# Altium schematic sheet signal_processing_assembly.SchDoc: Main Analog signal processing assembly
size A4; DocumentNumber: ADC-SCH-05; SheetNumber: 5; SheetTotal: 20
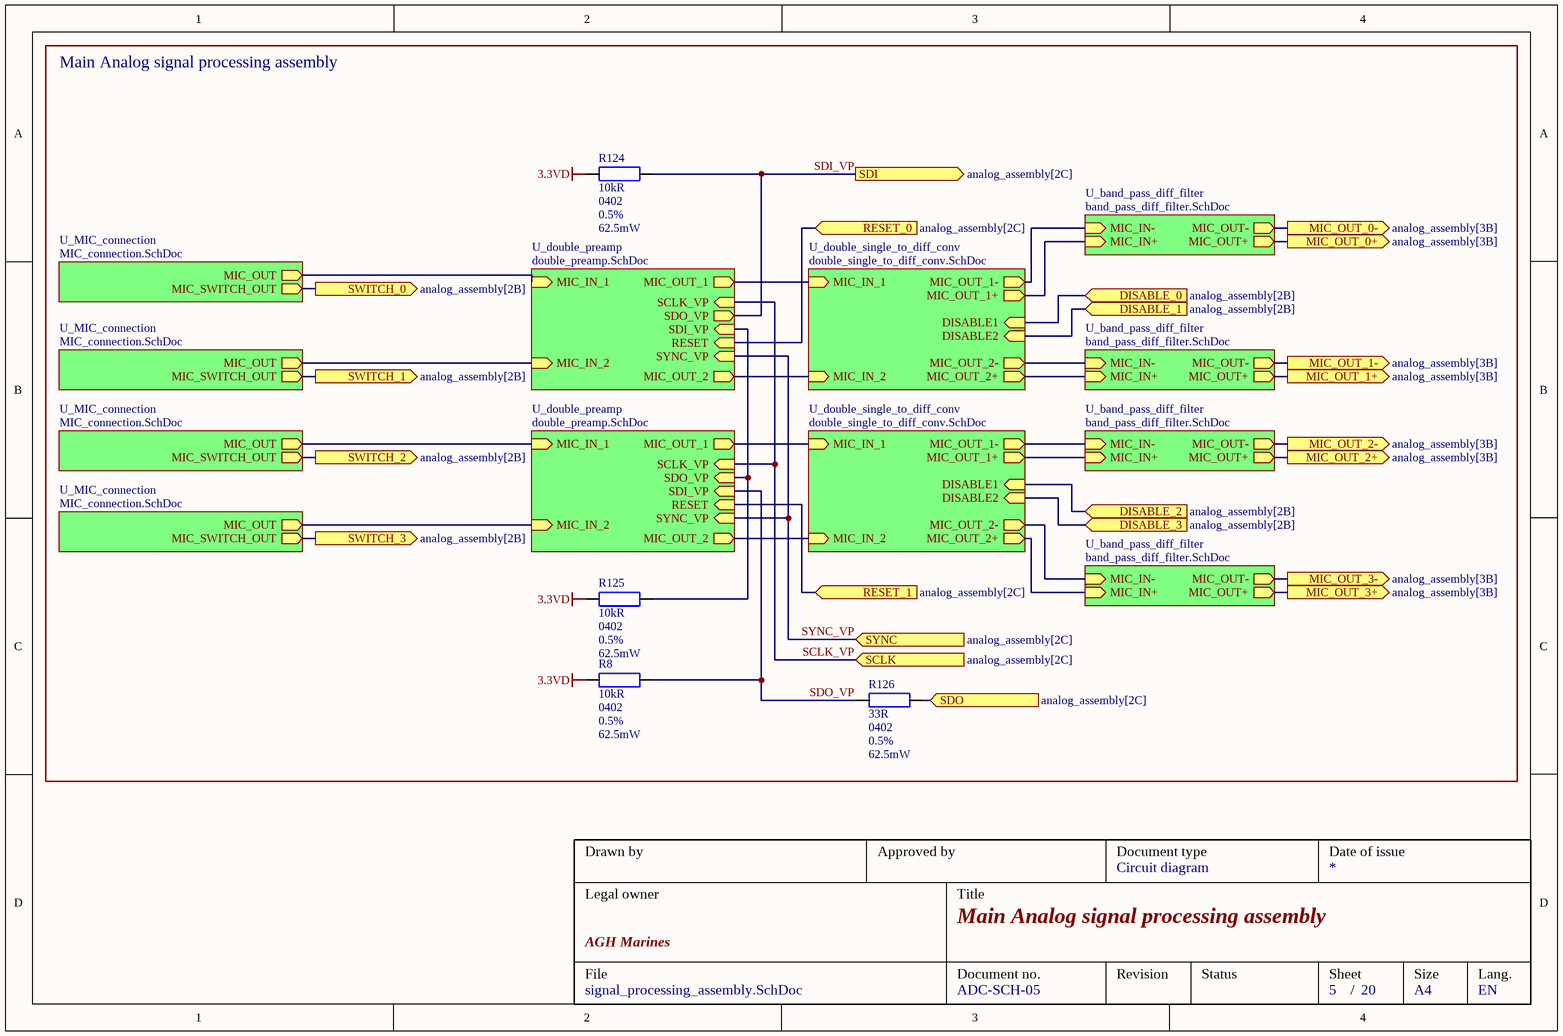
[diagram p0: signal_processing_assembly.SchDoc]

## Parts
R8  value 10kR  Package: 0402  Tolerance: 0.5%  Power: 62.5mW  [RESC_0402]  (hidden comment: AC0402DR-0710KL)
R124  value 10kR  Package: 0402  Tolerance: 0.5%  Power: 62.5mW  [RESC_0402]  (hidden comment: AC0402DR-0710KL)
R125  value 10kR  Package: 0402  Tolerance: 0.5%  Power: 62.5mW  [RESC_0402]  (hidden comment: AC0402DR-0710KL)
R126  value 33R  Package: 0402  Tolerance: 0.5%  Power: 62.5mW  [RESC_0402]  (hidden comment: RG1005R-330-D-T10)

## Blocks framed on the sheet
Main Analog signal processing assembly: R8 R124-R126

## Sub-sheets
U_band_pass_diff_filter = band_pass_diff_filter.SchDoc: MIC_IN+ (in), MIC_IN- (in), MIC_OUT+ (out), MIC_OUT- (out)
U_band_pass_diff_filter = band_pass_diff_filter.SchDoc: MIC_IN+ (in), MIC_IN- (in), MIC_OUT+ (out), MIC_OUT- (out)
U_band_pass_diff_filter = band_pass_diff_filter.SchDoc: MIC_IN+ (in), MIC_IN- (in), MIC_OUT+ (out), MIC_OUT- (out)
U_band_pass_diff_filter = band_pass_diff_filter.SchDoc: MIC_IN+ (in), MIC_IN- (in), MIC_OUT+ (out), MIC_OUT- (out)
U_double_preamp = double_preamp.SchDoc: MIC_IN_1 (in), MIC_OUT_1 (out), SDO_VP (out), SDI_VP (in), SYNC_VP (in), SCLK_VP (in), RESET (in), MIC_OUT_2 (out), MIC_IN_2 (in)
U_double_preamp = double_preamp.SchDoc: MIC_IN_1 (in), MIC_OUT_1 (out), SDO_VP (in), SDI_VP (in), SYNC_VP (in), SCLK_VP (in), RESET (in), MIC_OUT_2 (out), MIC_IN_2 (in)
U_double_single_to_diff_conv = double_single_to_diff_conv.SchDoc: DISABLE1 (in), DISABLE2 (in), MIC_OUT_1- (out), MIC_OUT_1+ (out), MIC_OUT_2- (out), MIC_OUT_2+ (out), MIC_IN_1 (in), MIC_IN_2 (in)
U_double_single_to_diff_conv = double_single_to_diff_conv.SchDoc: DISABLE1 (in), DISABLE2 (in), MIC_OUT_1- (out), MIC_OUT_1+ (out), MIC_OUT_2- (out), MIC_OUT_2+ (out), MIC_IN_1 (in), MIC_IN_2 (in)
U_MIC_connection = MIC_connection.SchDoc: MIC_OUT (out), MIC_SWITCH_OUT (out)
U_MIC_connection = MIC_connection.SchDoc: MIC_OUT (out), MIC_SWITCH_OUT (out)
U_MIC_connection = MIC_connection.SchDoc: MIC_OUT (out), MIC_SWITCH_OUT (out)
U_MIC_connection = MIC_connection.SchDoc: MIC_OUT (out), MIC_SWITCH_OUT (out)

## Ports
DISABLE_0 (in, see analog_assembly[2B]), DISABLE_1 (in, see analog_assembly[2B]), DISABLE_2 (in, see analog_assembly[2B]), DISABLE_3 (in, see analog_assembly[2B]), MIC_OUT_0+ (out, see analog_assembly[3B]), MIC_OUT_0- (out, see analog_assembly[3B]), MIC_OUT_1+ (out, see analog_assembly[3B]), MIC_OUT_1- (out, see analog_assembly[3B]), MIC_OUT_2+ (out, see analog_assembly[3B]), MIC_OUT_2- (out, see analog_assembly[3B]), MIC_OUT_3+ (out, see analog_assembly[3B]), MIC_OUT_3- (out, see analog_assembly[3B]), RESET_0 (in, see analog_assembly[2C]), RESET_1 (in, see analog_assembly[2C]), SCLK (in, see analog_assembly[2C]), SDI (out, see analog_assembly[2C]), SDO (in, see analog_assembly[2C]), SWITCH_0 (out, see analog_assembly[2B]), SWITCH_1 (out, see analog_assembly[2B]), SWITCH_2 (out, see analog_assembly[2B]), SWITCH_3 (out, see analog_assembly[2B]), SYNC (in, see analog_assembly[2C])

## Nets
3.3VD: R8.2 R124.2 R125.2
DISABLE_0: port DISABLE_0, sheet U_double_single_to_diff_conv/DISABLE1
DISABLE_1: port DISABLE_1, sheet U_double_single_to_diff_conv/DISABLE2
DISABLE_2: port DISABLE_2, sheet U_double_single_to_diff_conv/DISABLE1
DISABLE_3: port DISABLE_3, sheet U_double_single_to_diff_conv/DISABLE2
MIC_OUT_0+: port MIC_OUT_0+, sheet U_band_pass_diff_filter/MIC_OUT+
MIC_OUT_0-: port MIC_OUT_0-, sheet U_band_pass_diff_filter/MIC_OUT-
MIC_OUT_1+: port MIC_OUT_1+, sheet U_band_pass_diff_filter/MIC_OUT+
MIC_OUT_1-: port MIC_OUT_1-, sheet U_band_pass_diff_filter/MIC_OUT-
MIC_OUT_2+: port MIC_OUT_2+, sheet U_band_pass_diff_filter/MIC_OUT+
MIC_OUT_2-: port MIC_OUT_2-, sheet U_band_pass_diff_filter/MIC_OUT-
MIC_OUT_3+: port MIC_OUT_3+, sheet U_band_pass_diff_filter/MIC_OUT+
MIC_OUT_3-: port MIC_OUT_3-, sheet U_band_pass_diff_filter/MIC_OUT-
RESET_0: port RESET_0, sheet U_double_preamp/RESET
RESET_1: port RESET_1, sheet U_double_preamp/RESET
SCLK_VP: port SCLK, sheet U_double_preamp/SCLK_VP, sheet U_double_preamp/SCLK_VP
SDI_VP: R124.1 ; port SDI, sheet U_double_preamp/SDO_VP
SDO: R126.2 ; port SDO
SDO_VP: R8.1 R126.1 ; sheet U_double_preamp/SDI_VP
SWITCH_0: port SWITCH_0, sheet U_MIC_connection/MIC_SWITCH_OUT
SWITCH_1: port SWITCH_1, sheet U_MIC_connection/MIC_SWITCH_OUT
SWITCH_2: port SWITCH_2, sheet U_MIC_connection/MIC_SWITCH_OUT
SWITCH_3: port SWITCH_3, sheet U_MIC_connection/MIC_SWITCH_OUT
SYNC_VP: port SYNC, sheet U_double_preamp/SYNC_VP, sheet U_double_preamp/SYNC_VP
NetR125_1: R125.1 ; sheet U_double_preamp/SDI_VP, sheet U_double_preamp/SDO_VP
(unnamed): sheet U_MIC_connection/MIC_OUT, sheet U_double_preamp/MIC_IN_1
(unnamed): sheet U_MIC_connection/MIC_OUT, sheet U_double_preamp/MIC_IN_2
(unnamed): sheet U_MIC_connection/MIC_OUT, sheet U_double_preamp/MIC_IN_1
(unnamed): sheet U_MIC_connection/MIC_OUT, sheet U_double_preamp/MIC_IN_2
(unnamed): sheet U_double_preamp/MIC_OUT_1, sheet U_double_single_to_diff_conv/MIC_IN_1
(unnamed): sheet U_double_preamp/MIC_OUT_2, sheet U_double_single_to_diff_conv/MIC_IN_2
(unnamed): sheet U_double_preamp/MIC_OUT_1, sheet U_double_single_to_diff_conv/MIC_IN_1
(unnamed): sheet U_double_preamp/MIC_OUT_2, sheet U_double_single_to_diff_conv/MIC_IN_2
(unnamed): sheet U_double_single_to_diff_conv/MIC_OUT_1-, sheet U_band_pass_diff_filter/MIC_IN-
(unnamed): sheet U_double_single_to_diff_conv/MIC_OUT_1+, sheet U_band_pass_diff_filter/MIC_IN+
(unnamed): sheet U_double_single_to_diff_conv/MIC_OUT_2-, sheet U_band_pass_diff_filter/MIC_IN-
(unnamed): sheet U_double_single_to_diff_conv/MIC_OUT_2+, sheet U_band_pass_diff_filter/MIC_IN+
(unnamed): sheet U_double_single_to_diff_conv/MIC_OUT_1-, sheet U_band_pass_diff_filter/MIC_IN-
(unnamed): sheet U_double_single_to_diff_conv/MIC_OUT_1+, sheet U_band_pass_diff_filter/MIC_IN+
(unnamed): sheet U_double_single_to_diff_conv/MIC_OUT_2-, sheet U_band_pass_diff_filter/MIC_IN-
(unnamed): sheet U_double_single_to_diff_conv/MIC_OUT_2+, sheet U_band_pass_diff_filter/MIC_IN+

## Notes on the sheet
- Drawn by
- Approved by
- Document type
- Date of issue
- Legal owner
- Title
- Circuit diagram
- File
- AGH Marines
- Document no.
- Revision
- Status
- Sheet
- Size
- Lang.
- /
- A4
- EN

## Library data of the parts
R8 R124 R125 = AC0402DR-0710KL: Thick Film Resistors - SMD 10 kOhms 1/16 W 50 V 1% 0402 100 PPM / C - 55 C + 155 C AEC-Q200; Manufacturer: YAGEO; Supplier 1: Mouser; Supplier Part Number 1: 603-AC0402DR-0710KL
R126 = RG1005R-330-D-T10: Thin Film Resistors - SMD 1/16W 33 Ohms 0.5% 0402 100ppm; Manufacturer: Susumu; Supplier 1: Mouser; Supplier Part Number 1: 754-RG1005R-330DT10